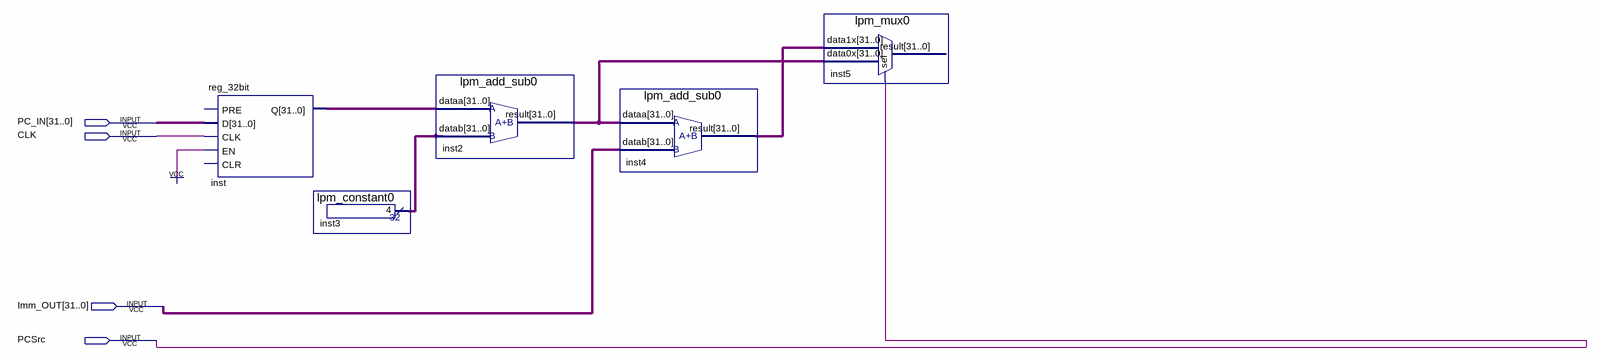
[diagram p0: schematic sheet]
// Quartus schematic PC_Unit.bdf as structural Verilog: 5 symbols, 4 pins
module PC_Unit (
  input  [31:0] PC_IN,
  input  CLK,
  input  [31:0] Imm_OUT,
  input  PCSrc
);

  wire [31:0] inst2_result, inst3_result, inst4_result, inst_q;

  reg_32bit inst (.D(PC_IN), .CLK(CLK), .EN(1'b1), .Q(inst_q));  // open: PRE, CLR
  lpm_constant0 inst3 (.result(inst3_result));
  lpm_add_sub0 inst2 (.dataa(inst_q), .datab(inst3_result), .result(inst2_result));
  lpm_add_sub0 inst4 (.dataa(inst2_result), .datab(Imm_OUT), .result(inst4_result));
  lpm_mux0 inst5 (.data1x(inst4_result), .data0x(inst2_result), .sel(PCSrc));  // open: result
endmodule
